# Altium schematic sheet USB_OTG.SchDoc
size A4; SheetNumber: 7; SheetTotal: 13
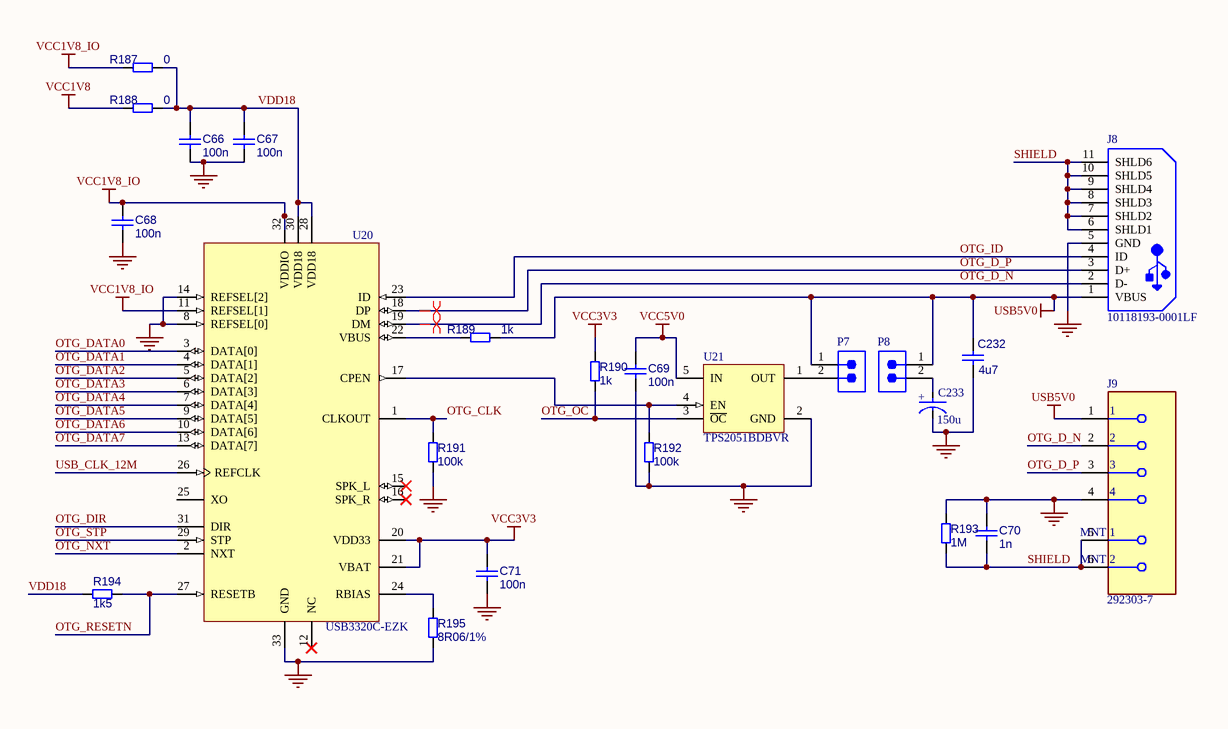
[diagram p0: USB_OTG.SchDoc]

## Parts
C66  100n  [CAPC1005X50N_0402]
C67  100n  [CAPC1005X50N_0402]
C68  100n  [CAPC1005X50N_0402]
C69  100n  [CAPC1005X50N_0402]
C70  1n  [CAPC1005X50N_0402]
C71  100n  [CAPC1005X50N_0402]
C232  4u7  [C_0805]
C233  150u  [FP-TAJD-MFG]
J8  10118193-0001LF  [FCI-10118193-0001LF-5_V]
J9  292303-7  [FP-292303-7-MFG]
P7  Male Pin Header 2x1 2.54mm  [Copy of Copy of Copy of Copy of 3M-2340-6111TG_V]  (value not drawn)
P8  Male Pin Header 2x1 2.54mm  [Copy of Copy of Copy of Copy of 3M-2340-6111TG_V]  (value not drawn)
R187  0  [R_0402]
R188  0  [R_0402]
R189  1k  [R_0402]
R190  1k  [R_0402]
R191  100k  [R_0402]
R192  100k  [R_0402]
R193  1M  [R_0402]
R194  1k5  [R_0402]
R195  8R06/1%  [R_0402]
U20  USB3320C-EZK  [MCHP-QFN-32-5x5_V2]
U21  TPS2051BDBVR  [DBV0005A_L]

## Nets
GND: C66.1 C67.1 C68.1 C69.1 C70.2 C71.1 C232.1 C233.1(C) J8.5(GND) J9.4 R191.2 R192.2 R193.1 R195.2 U20.8(REFSEL[0]) U20.14(REFSEL[2]) U20.33(GND) U21.2(GND)
USB5V0: C232.2 J8.1(VBUS) J9.1 P7.1 P8.1 R189.2
VCC1V8: R188.2
VCC1V8_IO: C68.2 R187.2 U20.11(REFSEL[1]) U20.32(VDDIO)
VCC3V3: C71.2 R190.1 U20.20(VDD33) U20.21(VBAT)
VCC5V0: C69.2 U21.5(IN)
OTG_CLK: R191.1 U20.1(CLKOUT)
OTG_D_N: J8.2(D-) J9.2 U20.19(DM)
OTG_D_P: J8.3(D+) J9.3 U20.18(DP)
OTG_DATA0: U20.3(DATA[0])
OTG_DATA1: U20.4(DATA[1])
OTG_DATA2: U20.5(DATA[2])
OTG_DATA3: U20.6(DATA[3])
OTG_DATA4: U20.7(DATA[4])
OTG_DATA5: U20.9(DATA[5])
OTG_DATA6: U20.10(DATA[6])
OTG_DATA7: U20.13(DATA[7])
OTG_DIR: U20.31(DIR)
OTG_ID: J8.4(ID) U20.23(ID)
OTG_NXT: U20.2(NXT)
OTG_OC: R190.2 U21.3(~{OC})
OTG_RESETN: R194.1 U20.27(RESETB)
OTG_STP: U20.29(STP)
SHIELD: C70.1 J8.6(SHLD1) J8.7(SHLD2) J8.8(SHLD3) J8.9(SHLD4) J8.10(SHLD5) J8.11(SHLD6) J9.5(MNT_1) J9.6(MNT_2) R193.2
USB_CLK_12M: U20.26(REFCLK)
VDD18: C66.2 C67.2 R187.1 R188.1 R194.2 U20.28(VDD18) U20.30(VDD18)
NetC233_2: C233.2(A) P8.2
NetP7_2: P7.2 U21.1(OUT)
NetR189_1: R189.1 U20.22(VBUS)
NetR192_1: R192.1 U20.17(CPEN) U21.4(EN)
NetR195_1: R195.1 U20.24(RBIAS)

Not connected (* = marked no-connect by the designer): U20 12(NC)* 15(SPK_L)* 16(SPK_R)* 25(XO)

## Layout directives
differential pair: OTG_D_N, OTG_D_P

## Notes on the sheet
- (in symbol CMP-04424-000170-1) +

## Library data of the parts
C66-C71 = CMP-001-00084-2: MLCC 0402
C232 = CMP-001-00086-2: MLCC 0805
C233 = CMP-04424-000170-1: 47uF 6.3V  ±20% 1.1Ω 2917  SMD Tantalum Capacitor; ESR (Equivalent Series Resistance): 1.1R; Dissipation Factor: 6%; Polarity: Polar; Voltage Rating: 6.3V; Width: 0.169inch; Tolerance: 20%; Series: TAJ; Case/Package: 2917; Max Operating Temperature: 125°C; Depth: 4.3mm; Voltage Rating (DC): 6.3V; Package Quantity: 500; Lead Free: Lead Free; Mount: Surface Mount; Length: 0.287inch; Min Operating Temperature: -55°C; Features: General Purpose; Packaging: Tape and Reel; Capacitance: 47uF; Height - Seated (Max): 0.122inch; RoHS Compliant: Yes
J8 = CMP-2000-05119-1: Micro USB B Type Receptacle, -55 to 85 degC, 5-Pin SMD, RoHS, Tape and Reel; Manufacturer: FCI; Insulation Resistance: 1000MOhms; Gender: Female; Current Rating: 1.8A; Number of Contacts: 5Contact; Connector Type: MicroUSBTypeBreceptacle; Mounting Angle: Right; Datasheet Version: Rev. C, 05/2015; Packaging: Reel; Product Category: USBConnectors; Standard: USB2.0; Factory Pack Quantity: 1200; Operating Temperature Range: -55Cto+85C; Termination Style: SMD/SMT; Datasheet URL: http://datasheet.octopart.com/10118193-0001LF-FCI-datasheet-55953155.pdf; Contact Material: CopperAlloy; RoHS: Details; Contact Plating: Gold; Flammability Rating: UL94V-0; Manufacturer URL: http://www.fci.com/; Brand: FCI; Product: MicroUSBTypeBConnectors; Color: Black
J9 = CMP-03360-000008-1: CONN RCPT USB2.0 TYPEA 4P SMD RA; Manufacturer: TE Connectivity; Is Female: yes; Current Rating: 1A; Number Of Contacts: 4; Voltage Rating: 30V; Conn Orientation: Right Angle; Shielding: true; Digikey Description: CONN RCPT USB2.0 TYPEA 4P SMD RA; Manufacturer Part Number: 292303-7; Automotive: No; Category: Conn; Temperature: -55°C to +85°C; ComponentLink2Description: Datasheet; Mouser Description: USB Connectors USB A R/A Recpt Assy SMT; Contact Material: Gold,Nickel; Package: 292303-7; Device Class L3: unset; Octopart: https://octopart.com/292303-7-te+connectivity-42840369; RoHS: TRUE; Device Class L2: USB Connectors; ComponentLink2URL: https://www.te.com/usa-en/product-292303-7.html?te_bu=Cor&te_type=other&te_campaign=oct_glo_cor-oct-global-oth-prtnr-fy19-oct-octo-buy-bom_sma-298_2&elqCampaignId=35216; Temperature Range Low: -55°C; Usb Standard: USB 2.0; Temperature Range High: +85°C; Lead Free: Yes; Device Class L1: Connectors
P7 P8 = CMP-002-00078-1: Male Header, Pitch 2.54 mm, 2x 1 Position, Height 8.636 mm, Tail Length 3.05 mm, -55 to 105 degC, RoHS, Bulk; Manufacturer: 3M; Max Current Rating: 3A; Rows: 1; Gender: Male; Max Operating Temperature: 105°C; Contact Finish: Gold; Datasheet URL: https://datasheet.ciiva.com/5161/ts0766-242217-5161112.pdf; Pins: 40; Package Description: Male Header, Pitch 2.54 mm, 1 x 40 Position, Height 8.636 mm, Tail Length 3.05 mm; Contact Material: Copper; Package Reference: 2340-6111TG; Package Quantity: 200; Current Rating: 3A; Datasheet Version: Aug-08; Min Operating Temperature: -55°C; Connector Type: Header; Contact Plating: Gold; Case/Package: 2340-6111TG; Packaging: Bulk; RoHS Compliant: True; Manufacturer URL: http://www.3m.com/; Lead Pitch: 0.1inch; Colour: Black; Mounting Technology: TH
R187-R195 = CMP-009-00178-3: Chip 0402 resistor
U20 = CMP-020-00028-1: Microchip USB3320C-EZK; USB Transceiver; USB 2.0 at 480Mbit/s; 32-Pin QFN; Max Supply Voltage: 2V; Frequency: 60MHz; Min Supply Voltage: 1.6V; Max Operating Temperature: 85°C; Mounting Technology: Surface Mount; Min Operating Temperature: -40°C; Pins: 32
U21 = CMP-2000-07277-1: Current-Limited, Power-Distribution Switch, 2.7 to 5.5 V, -40 to 85 degC, 5-Pin SOT-23 (DBV), Green (RoHS & no Sb/Br), Tape and Reel; Manufacturer: TexasInstruments; Number of Outputs: 1Output; Operating Supply Voltage: 2.7Vto5.5V; Supply Voltage - Min: 2.7V; Supply Voltage - Max: 5.5V; Current Limit: 1A; Development Kit: TPS2051BEVM; Output Current: 500mA; On Resistance - Max: 70mOhms; Package Version: 4073253-4/N, 12/2014; Mounting Technology: SurfaceMount; Packaging: Reel; Package / Case: SOT-23-5; Maximum Operating Temperature: +85C; Package Description: 5-Pin Small Outline Transistor, Body 2.9 x 1.6 mm, Pitch 0.95 mm; Type: HighSide; Product: USBCurrentLimitedPowerSwitches; Minimum Operating Temperature: -40C; Manufacturer URL: http://www.ti.com/; Factory Pack Quantity: 3000; Mounting Style: SMD/SMT; Brand: TexasInstruments; Package Reference: DBV5; Package URL: http://www.ti.com/lit/ml/mpds018l/mpds018l.pdf; Datasheet URL: http://www.ti.com/general/docs/lit/getliterature.tsp?genericPartNumber=TPS2051B&fileType=pdf; Product Category: PowerSwitchICs-PowerDistribution; Series: TPS2051B; Datasheet Version: Rev. L, 06/2011; RoHS: Details